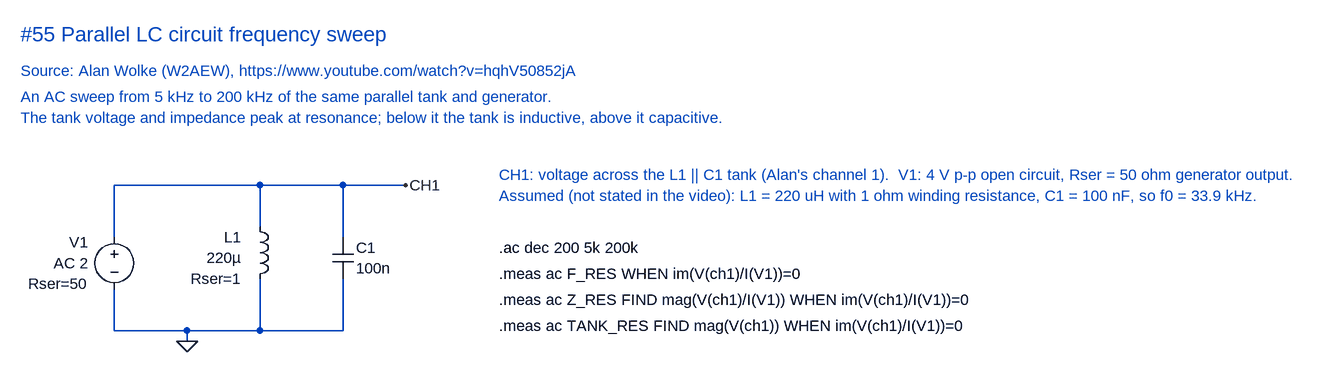
[diagram p0: schematic Parallel LC frequency sweep.asc]
Parallel LC frequency sweep.asc, the LTspice schematic file:
Version 4.1
SHEET 1 1992 700
WIRE 272 32 48 32
WIRE 400 32 272 32
WIRE 496 32 400 32
WIRE 272 96 272 32
WIRE 48 112 48 32
WIRE 400 112 400 32
WIRE 48 256 48 192
WIRE 160 256 48 256
WIRE 272 256 272 176
WIRE 272 256 160 256
WIRE 400 256 400 176
WIRE 400 256 272 256
WIRE 160 272 160 256
FLAG 160 272 0
FLAG 496 32 CH1
SYMBOL voltage 48 96 R0
WINDOW 0 -40 24 Right 2
WINDOW 3 -40 56 Right 2
WINDOW 123 0 0 Left 0
WINDOW 39 -40 88 Right 2
SYMATTR InstName V1
SYMATTR Value AC 2
SYMATTR SpiceLine Rser=50
SYMBOL ind 256 80 R0
WINDOW 0 -12 32 Right 2
WINDOW 3 -12 64 Right 2
WINDOW 39 -12 96 Right 2
SYMATTR InstName L1
SYMATTR Value 220µ
SYMATTR SpiceLine Rser=1
SYMBOL cap 384 112 R0
WINDOW 0 36 16 Left 2
WINDOW 3 36 48 Left 2
SYMATTR InstName C1
SYMATTR Value 100n
TEXT -96 -200 Left 3 ;#55 Parallel LC circuit frequency sweep
TEXT -96 -144 Left 2 ;Source: Alan Wolke (W2AEW), https://www.youtube.com/watch?v=hqhV50852jA
TEXT -96 -104 Left 2 ;An AC sweep from 5 kHz to 200 kHz of the same parallel tank and generator.
TEXT -96 -72 Left 2 ;The tank voltage and impedance peak at resonance; below it the tank is inductive, above it capacitive.
TEXT 640 16 Left 2 ;CH1: voltage across the L1 || C1 tank (Alan's channel 1).  V1: 4 V p-p open circuit, Rser = 50 ohm generator output.
TEXT 640 48 Left 2 ;Assumed (not stated in the video): L1 = 220 uH with 1 ohm winding resistance, C1 = 100 nF, so f0 = 33.9 kHz.
TEXT 640 128 Left 2 !.ac dec 200 5k 200k
TEXT 640 168 Left 2 !.meas ac F_RES WHEN im(V(ch1)/I(V1))=0
TEXT 640 208 Left 2 !.meas ac Z_RES FIND mag(V(ch1)/I(V1)) WHEN im(V(ch1)/I(V1))=0
TEXT 640 248 Left 2 !.meas ac TANK_RES FIND mag(V(ch1)) WHEN im(V(ch1)/I(V1))=0

The netlist it stands for:
* Parallel LC frequency sweep.asc
V1 CH1 0 AC 2 Rser=50
L1 CH1 0 220µ Rser=1
C1 CH1 0 100n
* #55 Parallel LC circuit frequency sweep
* Source: Alan Wolke (W2AEW), https://www.youtube.com/watch?v=hqhV50852jA
* An AC sweep from 5 kHz to 200 kHz of the same parallel tank and generator.
* The tank voltage and impedance peak at resonance; below it the tank is inductive, above it capacitive.
* CH1: voltage across the L1 || C1 tank (Alan's channel 1).  V1: 4 V p-p open circuit, Rser = 50 ohm generator output.
* Assumed (not stated in the video): L1 = 220 uH with 1 ohm winding resistance, C1 = 100 nF, so f0 = 33.9 kHz.
.ac dec 200 5k 200k
.meas ac F_RES WHEN im(V(ch1)/I(V1))=0
.meas ac Z_RES FIND mag(V(ch1)/I(V1)) WHEN im(V(ch1)/I(V1))=0
.meas ac TANK_RES FIND mag(V(ch1)) WHEN im(V(ch1)/I(V1))=0
.backanno
.end